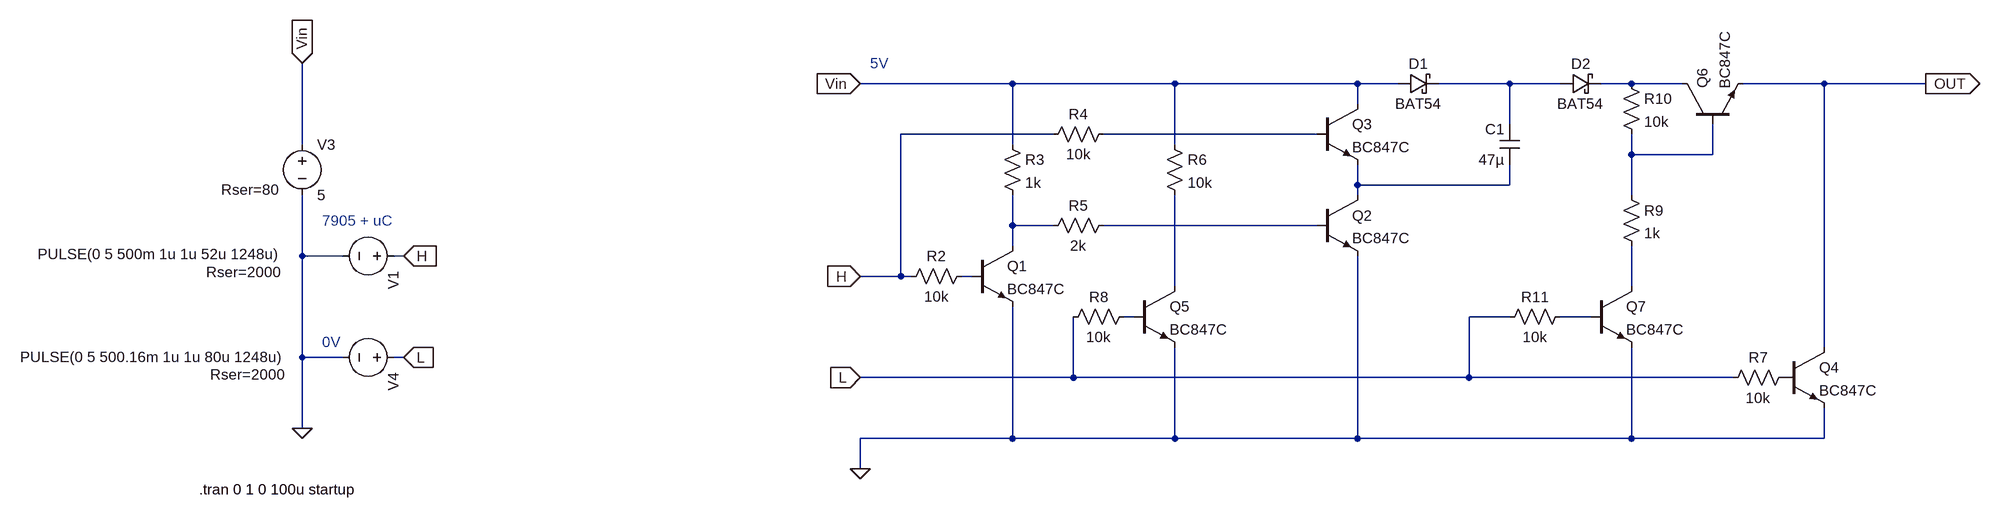
[diagram p0: schematic DriverA8.asc]
DriverA8.asc, the LTspice schematic file:
Version 4
SHEET 1 1772 804
WIRE 208 16 -32 16
WIRE 464 16 208 16
WIRE 752 16 464 16
WIRE 816 16 752 16
WIRE 992 16 880 16
WIRE 1072 16 992 16
WIRE 1184 16 1136 16
WIRE 1264 16 1184 16
WIRE 1488 16 1360 16
WIRE 1648 16 1488 16
WIRE 752 48 752 16
WIRE 992 80 992 16
WIRE 272 96 32 96
WIRE 688 96 352 96
WIRE -912 112 -912 -16
WIRE 208 112 208 16
WIRE 464 112 464 16
WIRE 1184 128 1184 96
WIRE 1312 128 1312 80
WIRE 1312 128 1184 128
WIRE 752 176 752 144
WIRE 992 176 992 144
WIRE 992 176 752 176
WIRE 752 192 752 176
WIRE 1184 192 1184 128
WIRE 208 240 208 192
WIRE 272 240 208 240
WIRE 688 240 352 240
WIRE 208 272 208 240
WIRE -912 288 -912 192
WIRE -848 288 -912 288
WIRE -752 288 -768 288
WIRE 32 320 32 96
WIRE 32 320 -32 320
WIRE 48 320 32 320
WIRE 144 320 128 320
WIRE 464 336 464 192
WIRE 1184 336 1184 272
WIRE 400 384 384 384
WIRE 992 384 928 384
WIRE 1120 384 1072 384
WIRE 1488 432 1488 16
WIRE -912 448 -912 288
WIRE -848 448 -912 448
WIRE -752 448 -768 448
WIRE 304 480 304 384
WIRE 304 480 -32 480
WIRE 928 480 928 384
WIRE 928 480 304 480
WIRE 1344 480 928 480
WIRE -912 560 -912 448
WIRE 208 576 208 368
WIRE 208 576 -32 576
WIRE 464 576 464 432
WIRE 464 576 208 576
WIRE 752 576 752 288
WIRE 752 576 464 576
WIRE 1184 576 1184 432
WIRE 1184 576 752 576
WIRE 1488 576 1488 528
WIRE 1488 576 1184 576
WIRE -32 624 -32 576
FLAG 1648 16 OUT
IOPIN 1648 16 Out
FLAG -912 560 0
FLAG -32 320 H
IOPIN -32 320 In
FLAG -32 480 L
IOPIN -32 480 In
FLAG -32 16 Vin
IOPIN -32 16 In
FLAG -32 624 0
FLAG -912 -16 Vin
IOPIN -912 -16 In
FLAG -752 288 H
IOPIN -752 288 In
FLAG -752 448 L
IOPIN -752 448 In
SYMBOL voltage -752 288 R90
WINDOW 3 -3 192 VRight 2
WINDOW 123 0 0 Left 0
WINDOW 39 25 192 VRight 2
SYMATTR InstName V1
SYMATTR Value PULSE(0 5 500m 1u 1u 52u 1248u)
SYMATTR SpiceLine Rser=2000
SYMBOL cap 1008 144 R180
WINDOW 0 24 56 Left 2
WINDOW 3 24 8 Left 2
SYMATTR InstName C1
SYMATTR Value 47µ
SYMBOL schottky 816 32 R270
WINDOW 0 32 32 VTop 2
WINDOW 3 0 32 VBottom 2
SYMATTR InstName D1
SYMATTR Value BAT54
SYMATTR Description Diode
SYMATTR Type diode
SYMBOL schottky 1072 32 R270
WINDOW 0 32 32 VTop 2
WINDOW 3 0 32 VBottom 2
SYMATTR InstName D2
SYMATTR Value BAT54
SYMATTR Description Diode
SYMATTR Type diode
SYMBOL voltage -912 96 R0
WINDOW 123 0 0 Left 0
WINDOW 39 -128 87 Left 2
SYMATTR InstName V3
SYMATTR Value 5
SYMATTR SpiceLine Rser=80
SYMBOL npn 144 272 R0
SYMATTR InstName Q1
SYMATTR Value BC847C
SYMBOL res 144 304 R90
WINDOW 0 0 56 VBottom 2
WINDOW 3 32 56 VTop 2
SYMATTR InstName R2
SYMATTR Value 10k
SYMBOL res 192 96 R0
SYMATTR InstName R3
SYMATTR Value 1k
SYMBOL npn 688 192 R0
SYMATTR InstName Q2
SYMATTR Value BC847C
SYMBOL res 368 224 R90
WINDOW 0 0 56 VBottom 2
WINDOW 3 32 56 VTop 2
SYMATTR InstName R5
SYMATTR Value 2k
SYMBOL npn 688 48 R0
SYMATTR InstName Q3
SYMATTR Value BC847C
SYMBOL res 368 80 R90
WINDOW 0 0 56 VBottom 2
WINDOW 3 32 56 VTop 2
SYMATTR InstName R4
SYMATTR Value 10k
SYMBOL voltage -752 448 R90
WINDOW 3 -1 186 VRight 2
WINDOW 123 0 0 Left 0
WINDOW 39 27 186 VRight 2
SYMATTR InstName V4
SYMATTR Value PULSE(0 5 500.16m 1u 1u 80u 1248u)
SYMATTR SpiceLine Rser=2000
SYMBOL npn 1424 432 R0
SYMATTR InstName Q4
SYMATTR Value BC847C
SYMBOL npn 400 336 R0
SYMATTR InstName Q5
SYMATTR Value BC847C
SYMBOL res 448 96 R0
SYMATTR InstName R6
SYMATTR Value 10k
SYMBOL res 1440 464 R90
WINDOW 0 0 56 VBottom 2
WINDOW 3 32 56 VTop 2
SYMATTR InstName R7
SYMATTR Value 10k
SYMBOL res 400 368 R90
WINDOW 0 0 56 VBottom 2
WINDOW 3 32 56 VTop 2
SYMATTR InstName R8
SYMATTR Value 10k
SYMBOL npn 1264 80 R270
SYMATTR InstName Q6
SYMATTR Value BC847C
SYMBOL res 1168 176 R0
SYMATTR InstName R9
SYMATTR Value 1k
SYMBOL npn 1120 336 R0
SYMATTR InstName Q7
SYMATTR Value BC847C
SYMBOL res 1168 0 R0
SYMATTR InstName R10
SYMATTR Value 10k
SYMBOL res 1088 368 R90
WINDOW 0 0 56 VBottom 2
WINDOW 3 32 56 VTop 2
SYMATTR InstName R11
SYMATTR Value 10k
TEXT -1074 656 Left 2 !.tran 0 1 0 100u startup
TEXT -880 232 Left 2 ;7905 + uC
TEXT -16 -16 Left 2 ;5V
TEXT -880 424 Left 2 ;0V

The netlist it stands for:
* DriverA8.asc
V1 H 0 PULSE(0 5 500m 1u 1u 52u 1248u) Rser=2000
C1 N005 N001 47µ
D1 Vin N001 BAT54
D2 N001 N002 BAT54
V3 Vin 0 5 Rser=80
Q1 N006 N008 0 0 BC847C
R2 N008 H 10k
R3 Vin N006 1k
Q2 N005 N007 0 0 BC847C
R5 N007 N006 2k
Q3 Vin N003 N005 0 BC847C
R4 N003 H 10k
V4 L 0 PULSE(0 5 500.16m 1u 1u 80u 1248u) Rser=2000
Q4 OUT P001 0 0 BC847C
Q5 N009 N011 0 0 BC847C
R6 Vin N009 10k
R7 P001 L 10k
R8 N011 L 10k
Q6 N002 N004 OUT 0 BC847C
R9 N004 N010 1k
Q7 N010 N012 0 0 BC847C
R10 N002 N004 10k
R11 N012 L 10k
.model D D
.lib standard.dio
.model NPN NPN
.model PNP PNP
.lib standard.bjt
.tran 0 1 0 100u startup
* 7905 + uC
* 5V
* 0V
.backanno
.end